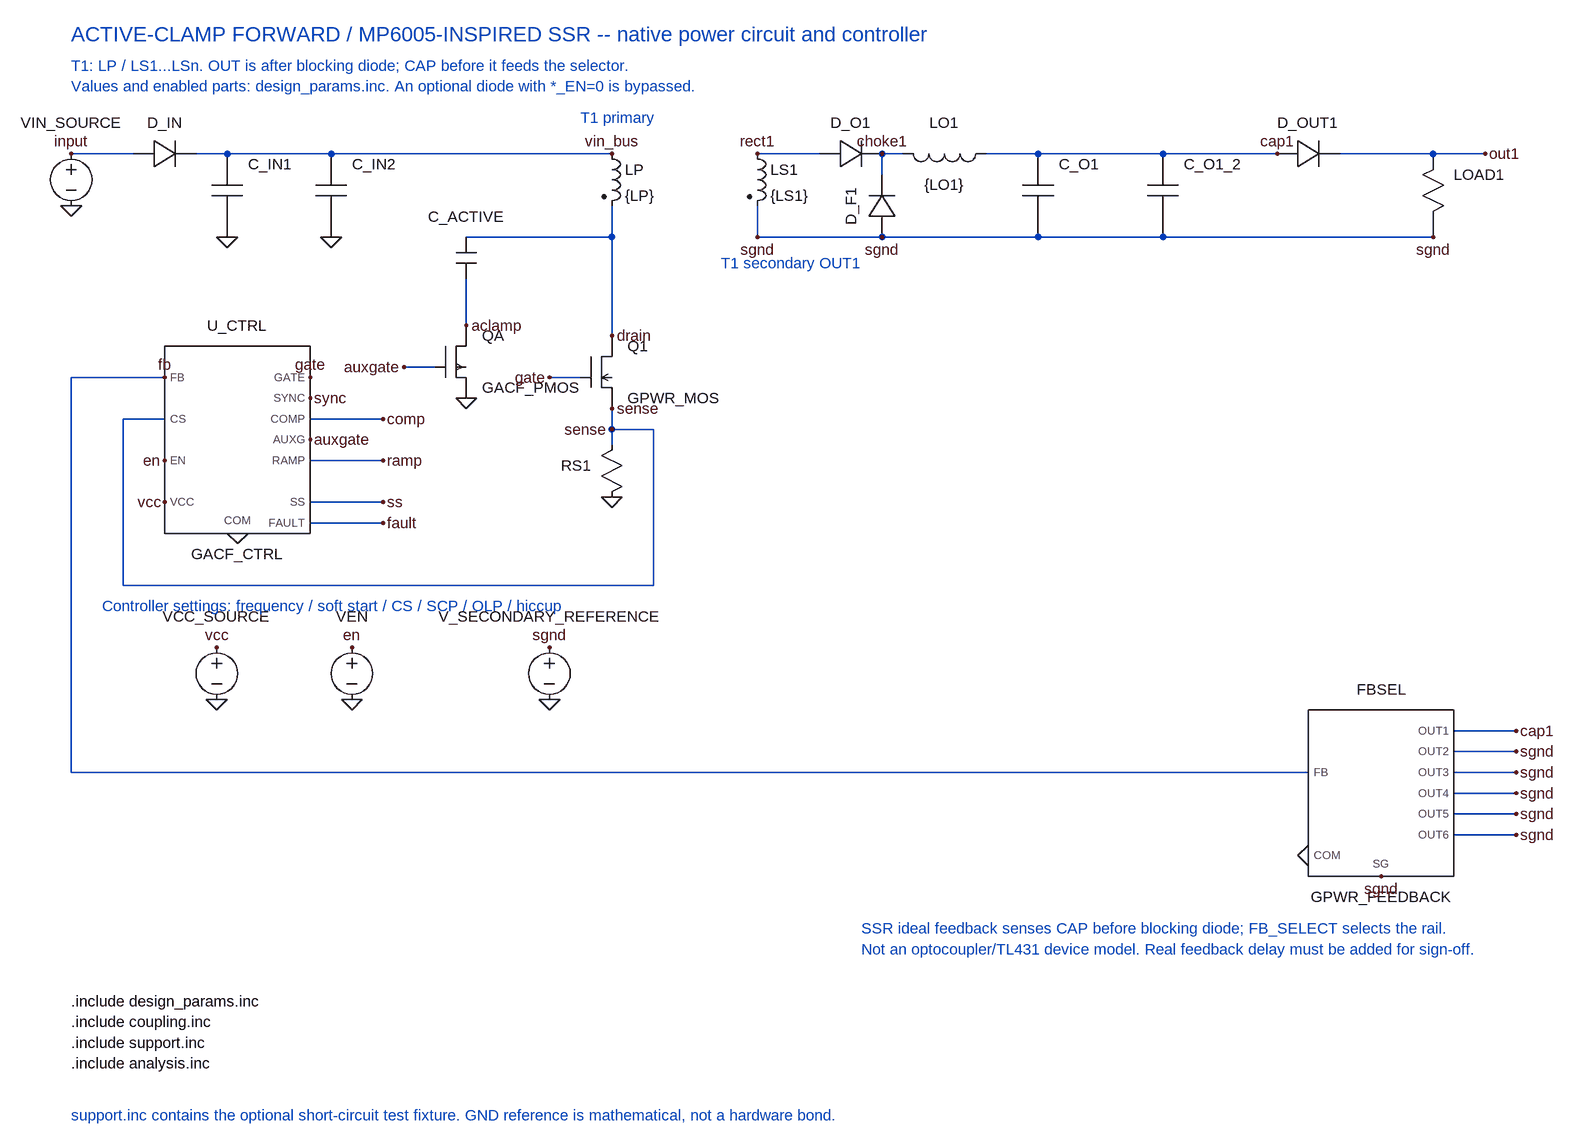
[diagram p0: schematic ACF_Forward_1.asc]
ACF_Forward_1.asc, the LTspice schematic file:
Version 4
SHEET 1 880 680
WIRE 64 200 160 200
WIRE 256 200 896 200
WIRE 896 280 896 480
WIRE 896 592 896 648
WIRE 208 608 144 608
WIRE 144 608 144 864
WIRE 144 864 960 864
WIRE 960 864 960 624
WIRE 960 624 896 624
WIRE 432 608 544 608
WIRE 432 672 544 672
WIRE 432 736 544 736
WIRE 432 768 544 768
WIRE 1120 200 1216 200
WIRE 1552 200 1744 200
WIRE 1744 200 1920 200
WIRE 2016 200 2160 200
WIRE 2160 200 2240 200
WIRE 1552 328 1744 328
WIRE 1744 328 2160 328
WIRE 1120 280 1120 328
WIRE 1120 328 1552 328
WIRE 2192 1088 2288 1088
WIRE 2192 1120 2288 1120
WIRE 2192 1152 2288 1152
WIRE 2192 1184 2288 1184
WIRE 2192 1216 2288 1216
WIRE 2192 1248 2288 1248
WIRE 1968 1152 64 1152
WIRE 64 1152 64 544
WIRE 64 544 208 544
WIRE 672 328 896 328
WIRE 672 392 672 464
WIRE 624 528 576 528
WIRE 848 544 800 544
WIRE 1312 200 1344 200
WIRE 1472 200 1552 200
WIRE 1312 200 1312 232
FLAG 64 280 0
FLAG 64 200 input
FLAG 896 200 vin_bus
FLAG 304 328 0
FLAG 464 328 0
FLAG 896 480 drain
FLAG 896 728 0
FLAG 896 592 sense
FLAG 432 544 gate
FLAG 896 624 sense
FLAG 544 608 comp
FLAG 544 672 ramp
FLAG 544 736 ss
FLAG 544 768 fault
FLAG 320 784 0
FLAG 208 672 en
FLAG 208 736 vcc
FLAG 288 960 vcc
FLAG 288 1040 0
FLAG 496 960 en
FLAG 496 1040 0
FLAG 1120 200 rect1
FLAG 1920 200 cap1
FLAG 2240 200 out1
FLAG 1120 328 sgnd
FLAG 2160 328 sgnd
FLAG 2288 1088 cap1
FLAG 2288 1120 sgnd
FLAG 2288 1152 sgnd
FLAG 2288 1184 sgnd
FLAG 2288 1216 sgnd
FLAG 2288 1248 sgnd
FLAG 2080 1312 sgnd
FLAG 1968 1280 0
FLAG 208 544 fb
FLAG 800 960 sgnd
FLAG 800 1040 0
FLAG 672 464 aclamp
FLAG 672 576 0
FLAG 576 528 auxgate
FLAG 800 544 gate
FLAG 432 576 sync
FLAG 432 640 auxgate
FLAG 1312 200 choke1
FLAG 1312 328 sgnd
SYMBOL PowerVoltage 64 184 R0
SYMATTR InstName VIN_SOURCE
SYMATTR Value {VIN}
SYMBOL PowerDiode 160 200 R0
SYMATTR InstName D_IN
SYMATTR Value GPWR_DIODE
SYMATTR SpiceLine VF={D_IN_VF} ACT={D_IN_EN} CJ={DIODE_CJ}
SYMBOL ind2 880 184 R0
SYMATTR InstName LP
SYMATTR Value {LP}
SYMATTR SpiceLine Rser={RP}
SYMBOL PowerCap 288 200 R0
SYMATTR InstName C_IN1
SYMATTR Value GPWR_CAP
SYMATTR SpiceLine C={C_IN1_C} ESR={C_IN1_ESR} ESL={C_IN1_ESL} ACT={C_IN1_EN}
SYMBOL PowerCap 448 200 R0
SYMATTR InstName C_IN2
SYMATTR Value GPWR_CAP
SYMATTR SpiceLine C={C_IN2_C} ESR={C_IN2_ESR} ESL={C_IN2_ESL} ACT={C_IN2_EN}
SYMBOL PowerMos 848 480 R0
SYMATTR InstName Q1
SYMATTR Value GPWR_MOS
SYMATTR SpiceLine RON={Q_RON} COSS={Q_COSS} CG={Q_CG} VG={VG} CJ={DIODE_CJ}
SYMBOL PowerSenseRes 880 632 R0
SYMATTR InstName RS1
SYMATTR Value {RSENSE}
SYMBOL GACF_CTRL 320 640 R0
SYMATTR InstName U_CTRL
SYMATTR Value GACF_CTRL
SYMATTR SpiceLine FSW={FSW} MODE={MODE} DMAX={DMAX} VM={VM} A_CS={A_CS} SLOPE={SLOPE} CS_LIM={CS_LIM} TBLANK={TBLANK} TONMIN={TONMIN} TPROP={TPROP} VG={VG} RDRV={RDRV} UVLO={UVLO} VSET={VSET} TSS={TSS} TYPE={TYPE} KP={KP} FZ1={FZ1} FP1={FP1} FZ2={FZ2} FP2={FP2} CMAX={CMAX} TEN={TEN} SSMODE={SSMODE} SSFRAC={SSFRAC} COFF={COFF} SSCLO={SSCLO} SSCHI={SSCHI} SCMODE={SCMODE} SCP={SCP} SCPBLANK={SCPBLANK} OLPEN={OLPEN} TOLP={TOLP} THOLD={THOLD} TOFF={TOFF} CS_TAU={CS_TAU} TDEAD={TDEAD} RSYNC={RSYNC}
SYMBOL PowerVoltage 288 944 R0
SYMATTR InstName VCC_SOURCE
SYMATTR Value {VG}
SYMBOL PowerVoltage 496 944 R0
SYMATTR InstName VEN
SYMATTR Value PULSE(0 1 1e-6 10e-9 10e-9 {2*TSTOP} {3*TSTOP})
SYMBOL ind2 1104 184 R0
SYMATTR InstName LS1
SYMATTR Value {LS1}
SYMATTR SpiceLine Rser={RS1}
SYMBOL PowerDiode 1216 200 R0
SYMATTR InstName D_O1
SYMATTR Value GPWR_DIODE
SYMATTR SpiceLine VF={D_O1_VF} ACT={D_O1_EN} CJ={DIODE_CJ}
SYMBOL PowerCap 1536 200 R0
SYMATTR InstName C_O1
SYMATTR Value GPWR_CAP
SYMATTR SpiceLine C={C_O1_C} ESR={C_O1_ESR} ESL={C_O1_ESL} ACT={C_O1_EN}
SYMBOL PowerCap 1728 200 R0
SYMATTR InstName C_O1_2
SYMATTR Value GPWR_CAP
SYMATTR SpiceLine C={C_O1_2_C} ESR={C_O1_2_ESR} ESL={C_O1_2_ESL} ACT={C_O1_2_EN}
SYMBOL PowerDiode 1920 200 R0
SYMATTR InstName D_OUT1
SYMATTR Value GPWR_DIODE
SYMATTR SpiceLine VF={D_OUT1_VF} ACT={D_OUT1_EN} CJ={DIODE_CJ}
SYMBOL PowerLoad 2144 200 R0
SYMATTR InstName LOAD1
SYMATTR Value I=V(out1,sgnd)/{RLOAD1}*(1+({LOAD_AFTER}-1)*limit((time-{TLOAD})/1e-6,0,1))
SYMBOL FeedbackSelector 2080 1184 R0
SYMATTR InstName FBSEL
SYMATTR Value GPWR_FEEDBACK
SYMATTR SpiceLine SEL={FB_SELECT} H={FB_SCALE}
SYMBOL PowerVoltage 800 944 R0
SYMATTR InstName V_SECONDARY_REFERENCE
SYMATTR Value 0
SYMBOL PowerSmallCap 656 328 R0
SYMATTR InstName C_ACTIVE
SYMATTR Value {C_ACTIVE}
SYMATTR SpiceLine Rser={ESR_ACTIVE}
SYMBOL PowerPmos 624 464 R0
SYMATTR InstName QA
SYMATTR Value GACF_PMOS
SYMATTR SpiceLine RON={QA_RON} COSS={QA_COSS} CG={QA_CG} VG={VG} CJ={DIODE_CJ}
SYMBOL PowerChoke 1344 200 R0
SYMATTR InstName LO1
SYMATTR Value {LO1}
SYMATTR SpiceLine Rser=0
SYMBOL PowerDiode 1312 328 R270
SYMATTR InstName D_F1
SYMATTR Value GPWR_DIODE
SYMATTR SpiceLine VF={D_O1_VF} CJ={DIODE_CJ}
TEXT 64 16 Left 3 ;ACTIVE-CLAMP FORWARD / MP6005-INSPIRED SSR -- native power circuit and controller
TEXT 64 64 Left 2 ;T1: LP / LS1...LSn. OUT is after blocking diode; CAP before it feeds the selector.
TEXT 64 96 Left 2 ;Values and enabled parts: design_params.inc. An optional diode with *_EN=0 is bypassed.
TEXT 848 144 Left 2 ;T1 primary
TEXT 112 896 Left 2 ;Controller settings: frequency / soft start / CS / SCP / OLP / hiccup
TEXT 1064 368 Left 2 ;T1 secondary OUT1
TEXT 1280 1392 Left 2 ;SSR ideal feedback senses CAP before blocking diode; FB_SELECT selects the rail.
TEXT 1280 1424 Left 2 ;Not an optocoupler/TL431 device model. Real feedback delay must be added for sign-off.
TEXT 64 1504 Left 2 !.include design_params.inc
TEXT 64 1536 Left 2 !.include coupling.inc
TEXT 64 1568 Left 2 !.include support.inc
TEXT 64 1600 Left 2 !.include analysis.inc
TEXT 64 1680 Left 2 ;support.inc contains the optional short-circuit test fixture. GND reference is mathematical, not a hardware bond.

The netlist it stands for:
* ACF_Forward_1.asc
VIN_SOURCE input 0 {VIN}
XD_IN input vin_bus GPWR_DIODE VF={D_IN_VF} ACT={D_IN_EN} CJ={DIODE_CJ}  ; pins A K
LP vin_bus drain {LP} Rser={RP}
XC_IN1 vin_bus 0 GPWR_CAP C={C_IN1_C} ESR={C_IN1_ESR} ESL={C_IN1_ESL} ACT={C_IN1_EN}  ; pins P N
XC_IN2 vin_bus 0 GPWR_CAP C={C_IN2_C} ESR={C_IN2_ESR} ESL={C_IN2_ESL} ACT={C_IN2_EN}  ; pins P N
XQ1 drain gate sense GPWR_MOS RON={Q_RON} COSS={Q_COSS} CG={Q_CG} VG={VG} CJ={DIODE_CJ}  ; pins D G S
RS1 sense 0 {RSENSE}
XU_CTRL fb sense en vcc gate comp ramp ss fault 0 sync auxgate GACF_CTRL FSW={FSW} MODE={MODE} DMAX={DMAX} VM={VM} A_CS={A_CS} SLOPE={SLOPE} CS_LIM={CS_LIM} TBLANK={TBLANK} TONMIN={TONMIN} TPROP={TPROP} VG={VG} RDRV={RDRV} UVLO={UVLO} VSET={VSET} TSS={TSS} TYPE={TYPE} KP={KP} FZ1={FZ1} FP1={FP1} FZ2={FZ2} FP2={FP2} CMAX={CMAX} TEN={TEN} SSMODE={SSMODE} SSFRAC={SSFRAC} COFF={COFF} SSCLO={SSCLO} SSCHI={SSCHI} SCMODE={SCMODE} SCP={SCP} SCPBLANK={SCPBLANK} OLPEN={OLPEN} TOLP={TOLP} THOLD={THOLD} TOFF={TOFF} CS_TAU={CS_TAU} TDEAD={TDEAD} RSYNC={RSYNC}  ; pins FB CS EN VCC GATE COMP RAMP SS FAULT COM SYNC AUXG
VCC_SOURCE vcc 0 {VG}
VEN en 0 PULSE(0 1 1e-6 10e-9 10e-9 {2*TSTOP} {3*TSTOP})
LS1 rect1 sgnd {LS1} Rser={RS1}
XD_O1 rect1 choke1 GPWR_DIODE VF={D_O1_VF} ACT={D_O1_EN} CJ={DIODE_CJ}  ; pins A K
XC_O1 cap1 sgnd GPWR_CAP C={C_O1_C} ESR={C_O1_ESR} ESL={C_O1_ESL} ACT={C_O1_EN}  ; pins P N
XC_O1_2 cap1 sgnd GPWR_CAP C={C_O1_2_C} ESR={C_O1_2_ESR} ESL={C_O1_2_ESL} ACT={C_O1_2_EN}  ; pins P N
XD_OUT1 cap1 out1 GPWR_DIODE VF={D_OUT1_VF} ACT={D_OUT1_EN} CJ={DIODE_CJ}  ; pins A K
B§LOAD1 out1 sgnd I=V(out1,sgnd)/{RLOAD1}*(1+({LOAD_AFTER}-1)*limit((time-{TLOAD})/1e-6,0,1))
XFBSEL cap1 sgnd sgnd sgnd sgnd sgnd sgnd fb 0 GPWR_FEEDBACK SEL={FB_SELECT} H={FB_SCALE}  ; pins OUT1 OUT2 OUT3 OUT4 OUT5 OUT6 SG FB COM
V_SECONDARY_REFERENCE sgnd 0 0
C_ACTIVE drain aclamp {C_ACTIVE} Rser={ESR_ACTIVE}
XQA aclamp auxgate 0 GACF_PMOS RON={QA_RON} COSS={QA_COSS} CG={QA_CG} VG={VG} CJ={DIODE_CJ}  ; pins D G S
LO1 choke1 cap1 {LO1} Rser=0
XD_F1 sgnd choke1 GPWR_DIODE VF={D_O1_VF} CJ={DIODE_CJ}  ; pins A K
* ACTIVE-CLAMP FORWARD / MP6005-INSPIRED SSR -- native power circuit and controller
* T1: LP / LS1...LSn. OUT is after blocking diode; CAP before it feeds the selector.
* Values and enabled parts: design_params.inc. An optional diode with *_EN=0 is bypassed.
* T1 primary
* Controller settings: frequency / soft start / CS / SCP / OLP / hiccup
* T1 secondary OUT1
* SSR ideal feedback senses CAP before blocking diode; FB_SELECT selects the rail.
* Not an optocoupler/TL431 device model. Real feedback delay must be added for sign-off.
.include design_params.inc
.include coupling.inc
.include support.inc
.include analysis.inc
* support.inc contains the optional short-circuit test fixture. GND reference is mathematical, not a hardware bond.
.lib GenericFlybackPWM.lib
.lib GenericACF_MP6005.lib
.backanno
.end